# Altium schematic sheet Nyquist_LA_Top.SchDoc: Nyquist LA Top
size A4; SheetNumber: 2; SheetTotal: 9
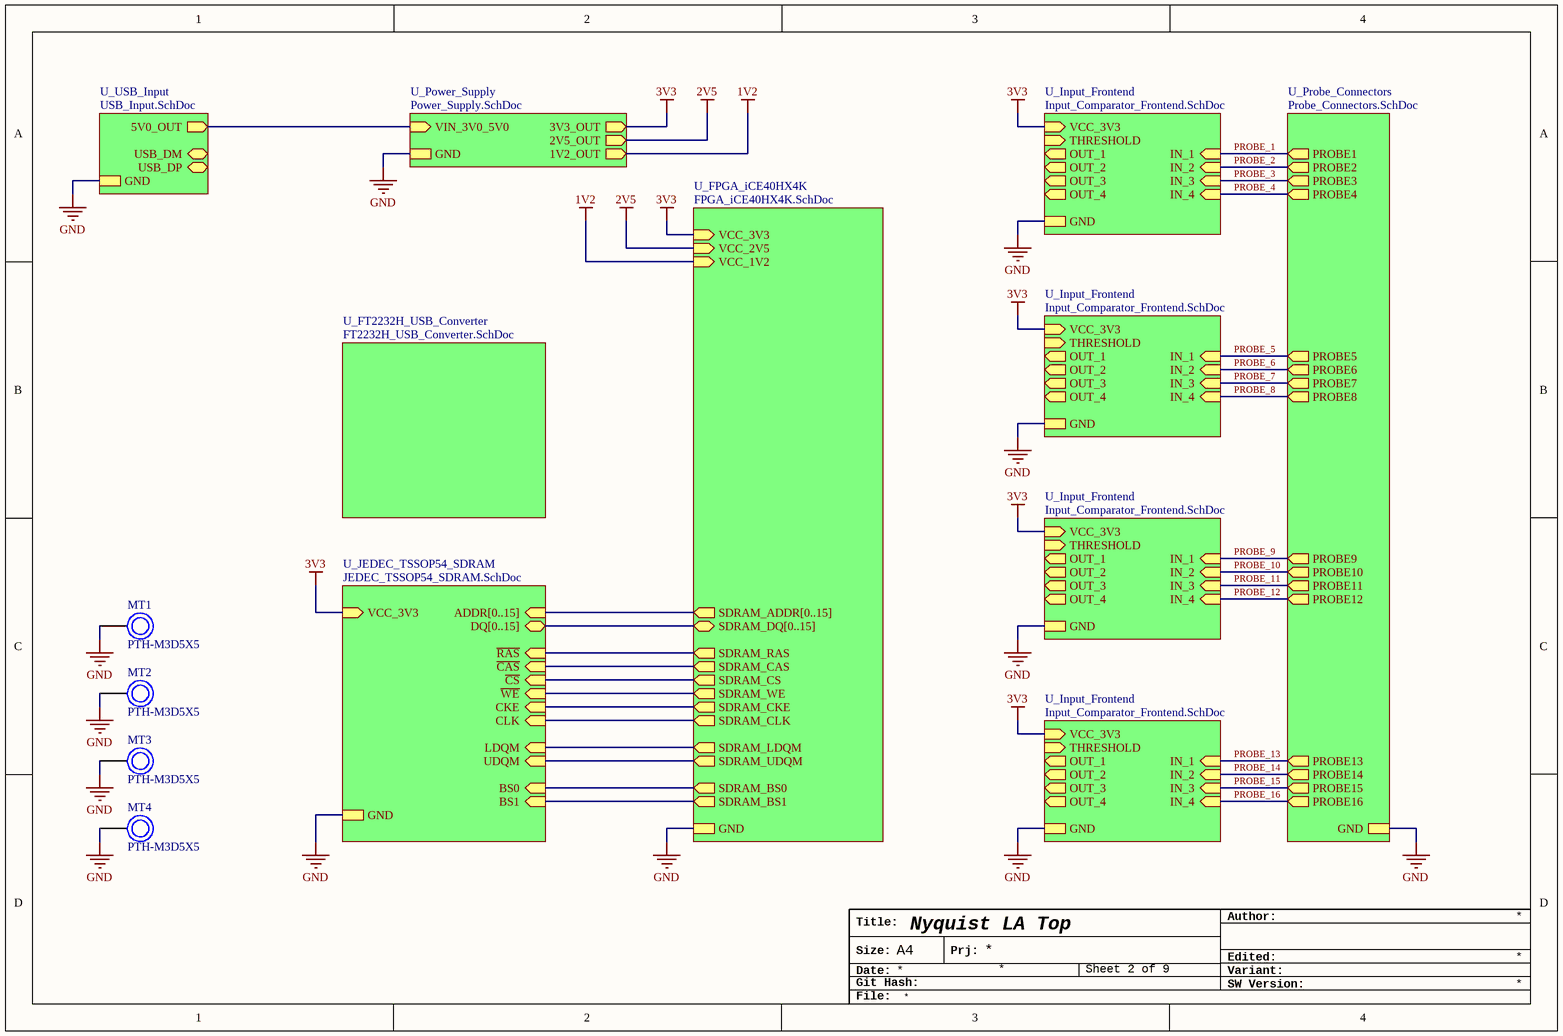
[diagram p0: Nyquist_LA_Top.SchDoc]

## Parts
MT1  PTH-M3D5X5  [M3_Mounting_Circular_Screw_L8mm]  (no BOM)
MT2  PTH-M3D5X5  [M3_Mounting_Circular_Screw_L8mm]  (no BOM)
MT3  PTH-M3D5X5  [M3_Mounting_Circular_Screw_L8mm]  (no BOM)
MT4  PTH-M3D5X5  [M3_Mounting_Circular_Screw_L8mm]  (no BOM)

## Sub-sheets
U_FPGA_iCE40HX4K = FPGA_iCE40HX4K.SchDoc: GND, VCC_3V3 (in), VCC_2V5 (in), VCC_1V2 (in), SDRAM_WE (out), SDRAM_CKE (out), SDRAM_CLK (out), SDRAM_LDQM (out), SDRAM_UDQM (out), SDRAM_BS0 (out), SDRAM_BS1 (out), SDRAM_ADDR[0..15] (out), SDRAM_DQ[0..15] (bidir), SDRAM_RAS (out), SDRAM_CAS (out), SDRAM_CS (out)
U_FT2232H_USB_Converter = FT2232H_USB_Converter.SchDoc: no entries
U_Input_Frontend = Input_Comparator_Frontend.SchDoc: IN_1 (in), IN_2 (in), IN_3 (in), IN_4 (in), OUT_1 (out), OUT_2 (out), OUT_3 (out), OUT_4 (out), GND, VCC_3V3 (in), THRESHOLD (in)
U_Input_Frontend = Input_Comparator_Frontend.SchDoc: IN_1 (in), IN_2 (in), IN_3 (in), IN_4 (in), OUT_1 (out), OUT_2 (out), OUT_3 (out), OUT_4 (out), GND, VCC_3V3 (in), THRESHOLD (in)
U_Input_Frontend = Input_Comparator_Frontend.SchDoc: IN_1 (in), IN_2 (in), IN_3 (in), IN_4 (in), OUT_1 (out), OUT_2 (out), OUT_3 (out), OUT_4 (out), GND, VCC_3V3 (in), THRESHOLD (in)
U_Input_Frontend = Input_Comparator_Frontend.SchDoc: IN_1 (in), IN_2 (in), IN_3 (in), IN_4 (in), OUT_1 (out), OUT_2 (out), OUT_3 (out), OUT_4 (out), GND, VCC_3V3 (in), THRESHOLD (in)
U_JEDEC_TSSOP54_SDRAM = JEDEC_TSSOP54_SDRAM.SchDoc: DQ[0..15] (bidir), ADDR[0..15] (in), GND, VCC_3V3 (in), ~{RAS} (in), ~{CAS} (in), ~{CS} (in), ~{WE} (in), CKE (in), CLK (in), LDQM (in), UDQM (in), BS0 (in), BS1 (in)
U_Power_Supply = Power_Supply.SchDoc: 3V3_OUT (out), 2V5_OUT (out), 1V2_OUT (out), VIN_3V0_5V0 (in), GND
U_Probe_Connectors = Probe_Connectors.SchDoc: GND, PROBE1 (out), PROBE2 (out), PROBE3 (out), PROBE4 (out), PROBE5 (out), PROBE6 (out), PROBE7 (out), PROBE8 (out), PROBE9 (out), PROBE10 (out), PROBE11 (out), PROBE12 (out), PROBE13 (out), PROBE14 (out), PROBE15 (out), PROBE16 (out)
U_USB_Input = USB_Input.SchDoc: 5V0_OUT (out), GND, USB_DM (bidir), USB_DP (bidir)

## Nets
1V2: sheet U_Power_Supply/1V2_OUT, sheet U_FPGA_iCE40HX4K/VCC_1V2
2V5: sheet U_Power_Supply/2V5_OUT, sheet U_FPGA_iCE40HX4K/VCC_2V5
3V3: sheet U_Power_Supply/3V3_OUT, sheet U_FPGA_iCE40HX4K/VCC_3V3, sheet U_JEDEC_TSSOP54_SDRAM/VCC_3V3, sheet U_Input_Frontend/VCC_3V3, sheet U_Input_Frontend/VCC_3V3, sheet U_Input_Frontend/VCC_3V3, sheet U_Input_Frontend/VCC_3V3
GND: MT1.MT MT2.MT MT3.MT MT4.MT ; sheet U_Power_Supply/GND, sheet U_USB_Input/GND, sheet U_FPGA_iCE40HX4K/GND, sheet U_Probe_Connectors/GND, sheet U_JEDEC_TSSOP54_SDRAM/GND, sheet U_Input_Frontend/GND, sheet U_Input_Frontend/GND, sheet U_Input_Frontend/GND, sheet U_Input_Frontend/GND
PROBE_1: sheet U_Probe_Connectors/PROBE1, sheet U_Input_Frontend/IN_1
PROBE_2: sheet U_Probe_Connectors/PROBE2, sheet U_Input_Frontend/IN_2
PROBE_3: sheet U_Probe_Connectors/PROBE3, sheet U_Input_Frontend/IN_3
PROBE_4: sheet U_Probe_Connectors/PROBE4, sheet U_Input_Frontend/IN_4
PROBE_5: sheet U_Probe_Connectors/PROBE5, sheet U_Input_Frontend/IN_1
PROBE_6: sheet U_Probe_Connectors/PROBE6, sheet U_Input_Frontend/IN_2
PROBE_7: sheet U_Probe_Connectors/PROBE7, sheet U_Input_Frontend/IN_3
PROBE_8: sheet U_Probe_Connectors/PROBE8, sheet U_Input_Frontend/IN_4
PROBE_9: sheet U_Probe_Connectors/PROBE9, sheet U_Input_Frontend/IN_1
PROBE_10: sheet U_Probe_Connectors/PROBE10, sheet U_Input_Frontend/IN_2
PROBE_11: sheet U_Probe_Connectors/PROBE11, sheet U_Input_Frontend/IN_3
PROBE_12: sheet U_Probe_Connectors/PROBE12, sheet U_Input_Frontend/IN_4
PROBE_13: sheet U_Probe_Connectors/PROBE13, sheet U_Input_Frontend/IN_1
PROBE_14: sheet U_Probe_Connectors/PROBE14, sheet U_Input_Frontend/IN_2
PROBE_15: sheet U_Probe_Connectors/PROBE15, sheet U_Input_Frontend/IN_3
PROBE_16: sheet U_Probe_Connectors/PROBE16, sheet U_Input_Frontend/IN_4
(unnamed): sheet U_Power_Supply/VIN_3V0_5V0, sheet U_USB_Input/5V0_OUT
(unnamed): sheet U_FPGA_iCE40HX4K/SDRAM_WE, sheet U_JEDEC_TSSOP54_SDRAM/~{WE}
(unnamed): sheet U_FPGA_iCE40HX4K/SDRAM_CKE, sheet U_JEDEC_TSSOP54_SDRAM/CKE
(unnamed): sheet U_FPGA_iCE40HX4K/SDRAM_CLK, sheet U_JEDEC_TSSOP54_SDRAM/CLK
(unnamed): sheet U_FPGA_iCE40HX4K/SDRAM_LDQM, sheet U_JEDEC_TSSOP54_SDRAM/LDQM
(unnamed): sheet U_FPGA_iCE40HX4K/SDRAM_UDQM, sheet U_JEDEC_TSSOP54_SDRAM/UDQM
(unnamed): sheet U_FPGA_iCE40HX4K/SDRAM_BS0, sheet U_JEDEC_TSSOP54_SDRAM/BS0
(unnamed): sheet U_FPGA_iCE40HX4K/SDRAM_BS1, sheet U_JEDEC_TSSOP54_SDRAM/BS1
(unnamed): sheet U_FPGA_iCE40HX4K/SDRAM_RAS, sheet U_JEDEC_TSSOP54_SDRAM/~{RAS}
(unnamed): sheet U_FPGA_iCE40HX4K/SDRAM_CAS, sheet U_JEDEC_TSSOP54_SDRAM/~{CAS}
(unnamed): sheet U_FPGA_iCE40HX4K/SDRAM_CS, sheet U_JEDEC_TSSOP54_SDRAM/~{CS}

## Buses and harness runs
bus sheet U_FPGA_iCE40HX4K/SDRAM_ADDR[0..15] = sheet U_JEDEC_TSSOP54_SDRAM/ADDR[0..15]
bus sheet U_FPGA_iCE40HX4K/SDRAM_DQ[0..15] = sheet U_JEDEC_TSSOP54_SDRAM/DQ[0..15]

## Notes on the sheet
- Title:
- Author:
- Size:
- Date:
- Git Hash:
- A4
- Prj:
- SW Version:
- Variant:
- Edited:
- File:

## Library data of the parts
MT1-MT4 = M3_Mounting_Hole: Mounting Hole 5mm x 5mm for M3 screws; Rule: UNIONINDEX=0|RULEKIND=PolygonConnect|NETSCOPE=AnyNet|LAYERKIND=SameLayer|NAME=Schematic Polygon Connect Style|CONNECTSTYLE=Direct|RELIEFCONDUCTORWIDTH=10mil|RELIEFENTRIES=4|POLYGONRELIEFANGLE=90 Angle|AIRGAPWIDTH=10mil|UNIT=Imperial